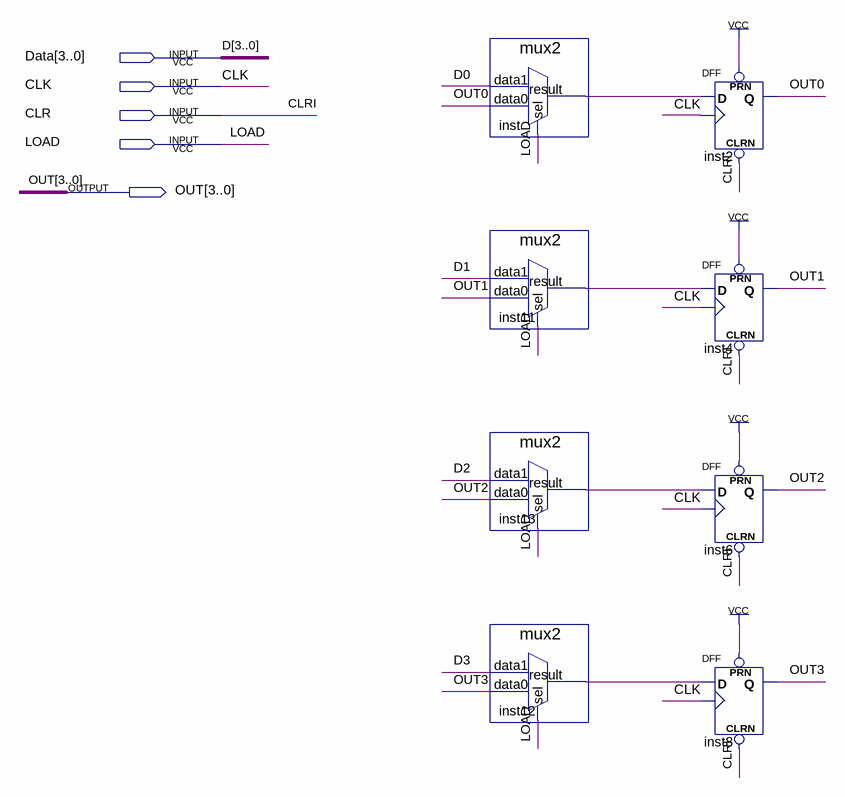
[diagram p0: schematic sheet]
// Quartus schematic reg4.bdf as structural Verilog: 8 symbols, 5 pins
module reg4 (
  input  [3:0] Data,
  input  CLK,
  input  CLR,
  input  LOAD,
  output [3:0] OUT
);

  wire inst11_result, inst12_result, inst13_result, inst_result;

  mux2 inst (.data1(Data[0]), .data0(OUT[0]), .sel(LOAD), .result(inst_result));
  mux2 inst11 (.data1(Data[1]), .data0(OUT[1]), .sel(LOAD), .result(inst11_result));
  mux2 inst13 (.data1(Data[2]), .data0(OUT[2]), .sel(LOAD), .result(inst13_result));
  mux2 inst12 (.data1(Data[3]), .data0(OUT[3]), .sel(LOAD), .result(inst12_result));
  DFF inst2 (.CLRN(CLR), .CLK(CLK), .D(inst_result), .PRN(1'b1), .Q(OUT[0]));
  DFF inst4 (.CLRN(CLR), .CLK(CLK), .D(inst11_result), .PRN(1'b1), .Q(OUT[1]));
  DFF inst6 (.CLRN(CLR), .CLK(CLK), .D(inst13_result), .PRN(1'b1), .Q(OUT[2]));
  DFF inst8 (.CLRN(CLR), .CLK(CLK), .D(inst12_result), .PRN(1'b1), .Q(OUT[3]));

  // Other names for the same wires on the sheet: CLRI = CLR; D[3:0] = Data; D0 = Data[0]; D1 = Data[1]; D2 = Data[2];
  //   D3 = Data[3]
endmodule
